# Altium schematic sheet ETHERNET.SchDoc
size A3; SheetNumber: 7; SheetTotal: 9
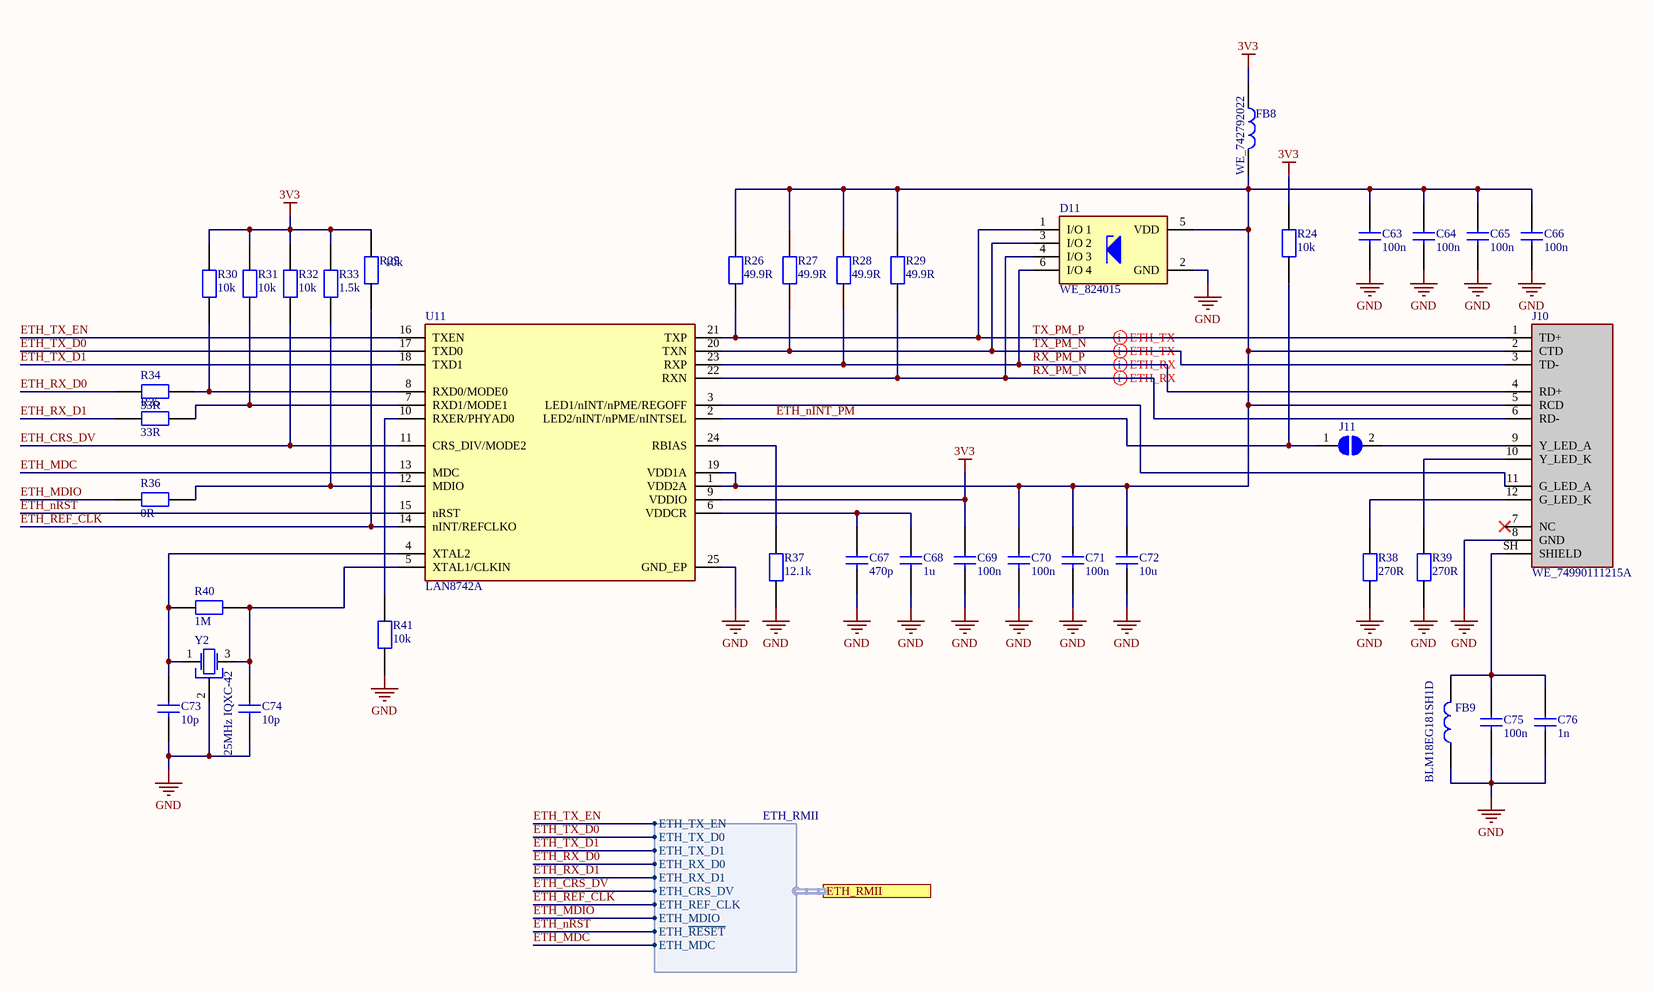
[diagram p0: ETHERNET.SchDoc]

## Parts
C63  value 100n  [0603C]  (hidden comment: 100nF 50V X7R 10%)
C64  value 100n  [0603C]  (hidden comment: 100nF 50V X7R 10%)
C65  value 100n  [0603C]  (hidden comment: 100nF 50V X7R 10%)
C66  value 100n  [0603C]  (hidden comment: 100nF 50V X7R 10%)
C67  value 470p  [0603C]  (hidden comment: 470pF 100V X7R 5%)
C68  value 1u  [0603C]  (hidden comment: 1uF 16V X5R 10%)
C69  value 100n  [0603C]  (hidden comment: 100nF 50V X7R 10%)
C70  value 100n  [0603C]  (hidden comment: 100nF 50V X7R 10%)
C71  value 100n  [0603C]  (hidden comment: 100nF 50V X7R 10%)
C72  value 10u  [0603C]  (hidden comment: 10uF 25V X5R 10%)
C73  value 10p  [0603C]  (hidden comment: 10pF 50V C0G 5%)
C74  value 10p  [0603C]  (hidden comment: 10pF 50V C0G 5%)
C75  value 100n  [0603C]  (hidden comment: 100nF 50V X7R 10%)
C76  value 1n  [0603C]  (hidden comment: 1nF 50V X7R 10%)
D11  WE_824015  [SOT95P280X110-6N]
FB8  WE_742792022  [0805FB]
FB9  BLM18EG181SH1D  [0603FB]
J10  WE_74990111215A  [Wurth 74990111215A]
J11  2 pole open jumper  [2_pole_open_jumper]  (value not drawn)  (no BOM)
R24  value 10k  [0603R]  (hidden comment: 10k 1% 0.1W)
R25  value 10k  [0603R]  (hidden comment: 10k 1% 0.1W)
R26  value 49.9R  [0603R]  (hidden comment: 49.9R 1% 0.1W)
R27  value 49.9R  [0603R]  (hidden comment: 49.9R 1% 0.1W)
R28  value 49.9R  [0603R]  (hidden comment: 49.9R 1% 0.1W)
R29  value 49.9R  [0603R]  (hidden comment: 49.9R 1% 0.1W)
R30  value 10k  [0603R]  (hidden comment: 10k 1% 0.1W)
R31  value 10k  [0603R]  (hidden comment: 10k 1% 0.1W)
R32  value 10k  [0603R]  (hidden comment: 10k 1% 0.1W)
R33  value 1.5k  [0603R]  (hidden comment: 1.5k 1% 0.1W)
R34  value 33R  [0603R]  (hidden comment: 33R 1% 0.1W)
R35  value 33R  [0603R]  (hidden comment: 33R 1% 0.1W)
R36  value 0R  [0603R]  (hidden comment: 0R 1% 0.1W)
R37  value 12.1k  [0603R]  (hidden comment: 12.1k 1% 0.125W)
R38  value 270R  [0603R]  (hidden comment: 270R 1% 0.125W)
R39  value 270R  [0603R]  (hidden comment: 270R 1% 0.125W)
R40  value 1M  [0603R]  (hidden comment: 1M 1% 0.1W)
R41  value 10k  [0603R]  (hidden comment: 10k 1% 0.1W)
U11  LAN8742A  [FP-24-S4QFN-4x4B-0_5P-IPC_B]
Y2  25MHz IQXC-42  [Quartz crystal 4pin 2x1.6mm]

## Ports
ETH_RMII (harness ETH_RMII)

## Harnesses
ETH_RMII: ETH_MDIO, ETH_~{RESET}, ETH_CRS_DV, ETH_RX_D1, ETH_RX_D0, ETH_TX_D1, ETH_TX_D0, ETH_TX_EN, ETH_REF_CLK, ETH_MDC

## Nets
3V3: C69.2 FB8.1 R24.1 R25.1 R30.1 R31.1 R32.1 R33.1 U11.9(VDDIO)
GND: C63.1 C64.1 C65.1 C66.1 C67.1 C68.1 C69.1 C70.1 C71.1 C72.1 C73.1 C74.1 C75.1 C76.1 D11.2(GND) FB9.1 J10.8(GND) R37.2 R38.2 R39.2 R41.2 U11.25(GND_EP) Y2.2(GND)
ETH_CRS_DV: R32.2 U11.11(CRS_DIV/MODE2) ; port ETH_RMII.ETH_CRS_DV
ETH_MDC: U11.13(MDC) ; port ETH_RMII.ETH_MDC
ETH_MDIO: R36.2 ; port ETH_RMII.ETH_MDIO
ETH_nINT_PM: J11.1 R24.2 U11.2(LED2/nINT/nPME/nINTSEL)
ETH_nRST: U11.15(nRST) ; port ETH_RMII.ETH_~{RESET}
ETH_REF_CLK: R25.2 U11.14(nINT/REFCLKO) ; port ETH_RMII.ETH_REF_CLK
ETH_RX_D0: R34.2 ; port ETH_RMII.ETH_RX_D0
ETH_RX_D1: R35.2 ; port ETH_RMII.ETH_RX_D1
ETH_TX_D0: U11.17(TXD0) ; port ETH_RMII.ETH_TX_D0
ETH_TX_D1: U11.18(TXD1) ; port ETH_RMII.ETH_TX_D1
ETH_TX_EN: U11.16(TXEN) ; port ETH_RMII.ETH_TX_EN
RX_PM_N: D11.4(I/O_3) J10.6(RD-) R29.2 U11.22(RXN)
RX_PM_P: D11.6(I/O_4) J10.4(RD+) R28.2 U11.23(RXP)
TX_PM_N: D11.3(I/O_2) J10.3(TD-) R27.2 U11.20(TXN)
TX_PM_P: D11.1(I/O_1) J10.1(TD+) R26.2 U11.21(TXP)
NetC63_2: C63.2 C64.2 C65.2 C66.2 C70.2 C71.2 C72.2 D11.5(VDD) FB8.2 J10.2(CTD) J10.5(RCD) R26.1 R27.1 R28.1 R29.1 U11.1(VDD2A) U11.19(VDD1A)
NetC67_2: C67.2 C68.2 U11.6(VDDCR)
NetC73_2: C73.2 R40.2 U11.4(XTAL2) Y2.1(Crystal)
NetC74_2: C74.2 R40.1 U11.5(XTAL1/CLKIN) Y2.3(Crystal)
NetC75_2: C75.2 C76.2 FB9.2 J10.SH(SHIELD)
NetJ10_9: J10.9(Y_LED_A) J11.2
NetJ10_10: J10.10(Y_LED_K) R39.1
NetJ10_11: J10.11(G_LED_A) U11.3(LED1/nINT/nPME/REGOFF)
NetJ10_12: J10.12(G_LED_K) R38.1
NetR30_2: R30.2 R34.1 U11.8(RXD0/MODE0)
NetR31_2: R31.2 R35.1 U11.7(RXD1/MODE1)
NetR33_2: R33.2 R36.1 U11.12(MDIO)
NetR37_1: R37.1 U11.24(RBIAS)
NetR41_1: R41.1 U11.10(RXER/PHYAD0)

Not connected (* = marked no-connect by the designer): J10 7(NC)*

## Layout directives
differential pair; differential pair class DIFF_ETH: RX_PM_N, RX_PM_P, TX_PM_N, TX_PM_P

## Notes on the sheet
- This document and the information it
- contains, including the principles of
- design are the proprietary confidential
- property of MC Electronics.
- Maciej Czerwiński Electronics
- NIP: PL1251711124
- Konopnickiej 16A
- 05-250 Radzymin
- biuro@mcelectronics.biz
- This information is submitted to you
- with the agreement that it is not to be
- disclosed to third parties without prior
- written consent from MC Electronics.
- Acceptance of this document constitutes
- Title:
- greement to these restrictions.
- Date:
- Project ID
- Sheet:
- of
- Module ID -
- Revision
- -
- Size A3

## Library data of the parts
C63-C66 C69-C71 C75 = GEN_100nF_50V_X7R_10%_0603: Generic capacitor 100n 0603; MC_ID: C00001; Generic: Yes; Mount type: SMT
C67 = GEN_470pF_100V_X7R_5%_0603: Generic capacitor 470p 0603; MC_ID: C00025; Generic: Yes; Mount type: SMT
C68 = GEN_1uF_16V_X5R_10%_0603: Generic capacitor 1u 0603; Generic: Yes; MC_ID: C00017; Mount type: SMT
C72 = GEN_10uF_25V_X5R_10%_0603: Generic capacitor 10u 0603; Generic: Yes; MC_ID: C00094; Mount type: SMT
C73 C74 = GEN_10pF_50V_C0G_5%_0603: Generic capacitor 10p 0603; MC_ID: C00002; Generic: Yes; Mount type: SMT
C76 = GEN_1nF_50V_X7R_10%_0603: Generic capacitor 1nF 50V 0603; MC_ID: C00024; Generic: Yes; Mount type: SMT
D11 = WE_824015: TVS for ethernet and USB 2.0; MC_ID: TVS00028; Generic: No; Mount type: SMT; Specific PN: WE_824015
FB8 = WE_742792022: Ferrite bead 0603 1A 50mOhm, 1MHz - 180Ohm; MC_ID: FB00017; Generic: No; Mount type: SMT; Specific PN: WE_742792022
FB9 = BLM18EG181SH1D: Ferrite bead 0603 1A 50mOhm, 1MHz - 180Ohm; Generic: No; MC_ID: FB00019; Specific PN: BLM18EG181SH1D; Mount type: SMT
J10 = WE_74990111215A: Ethernet connector with integrated isolation transformer and 2 LEDs; Generic: No; MC_ID: CON00210; Specific PN: WE_74990111215A; Mount type: THT
J11 = MC-CMP-016-00012-5: Generic: No; MC_ID: xx; Mount type: SMT
R24 R25 R30-R32 R41 = GEN_10k_1%_0.1W_0603: Generic resistor 10k 0603; MC_ID: R00003; Generic: Yes; Mount type: SMT
R26-R29 = GEN_49.9R_1%_0.1W_0603: Generic resistor 49.9R 0603; Generic: Yes; MC_ID: R00055; Mount type: SMT
R33 = GEN_1.5k_1%_0.1W_0603: Generic resistor 1.5k 0603; MC_ID: R00040; Generic: Yes; Mount type: SMT
R34 R35 = GEN_33R_1%_0.1W_0603: Generic resistor 33R 0603; MC_ID: R00050; Generic: Yes; Mount type: SMT
R36 = GEN_0R_1%_0.1W_0603: Generic resistor 0R 0603; Generic: Yes; MC_ID: R00300; Mount type: SMT
R37 = SPEC_12.1k_1%_0.125W_0603: Rezystor 12.1k 1% 0.125W; Generic: Yes; Specific PN: CRCW060312K1FKTABC; MC_ID: R00345; Mount type: SMT
R38 R39 = SPEC_270R_1%_0.125W_0603: Rezystor 270R 1% 0.125W; Generic: Yes; Specific PN: RC0603FR-07270RL; MC_ID: R00042; Mount type: SMT
R40 = GEN_1M_1%_0.1W_0603: Generic resistor 1M 0603; MC_ID: R00014; Generic: Yes; Mount type: SMT
U11 = LAN8742A: Small Footprint RMII 10/100 Ethernet Transceiver with HP / Auto-MDIX and flexPWR® Technology, QFN24; Generic: No; MC_ID: IC00767; Specific PN: LAN8742A-CZ; Mount type: SMT
Y2 = 25MHz IQXC-42: Quarz oscilator 25MHz 2x1.6x0.5mm; Generic: No; Specific PN: WE_830108212509; MC_ID: XTA00012; Mount type: SMT